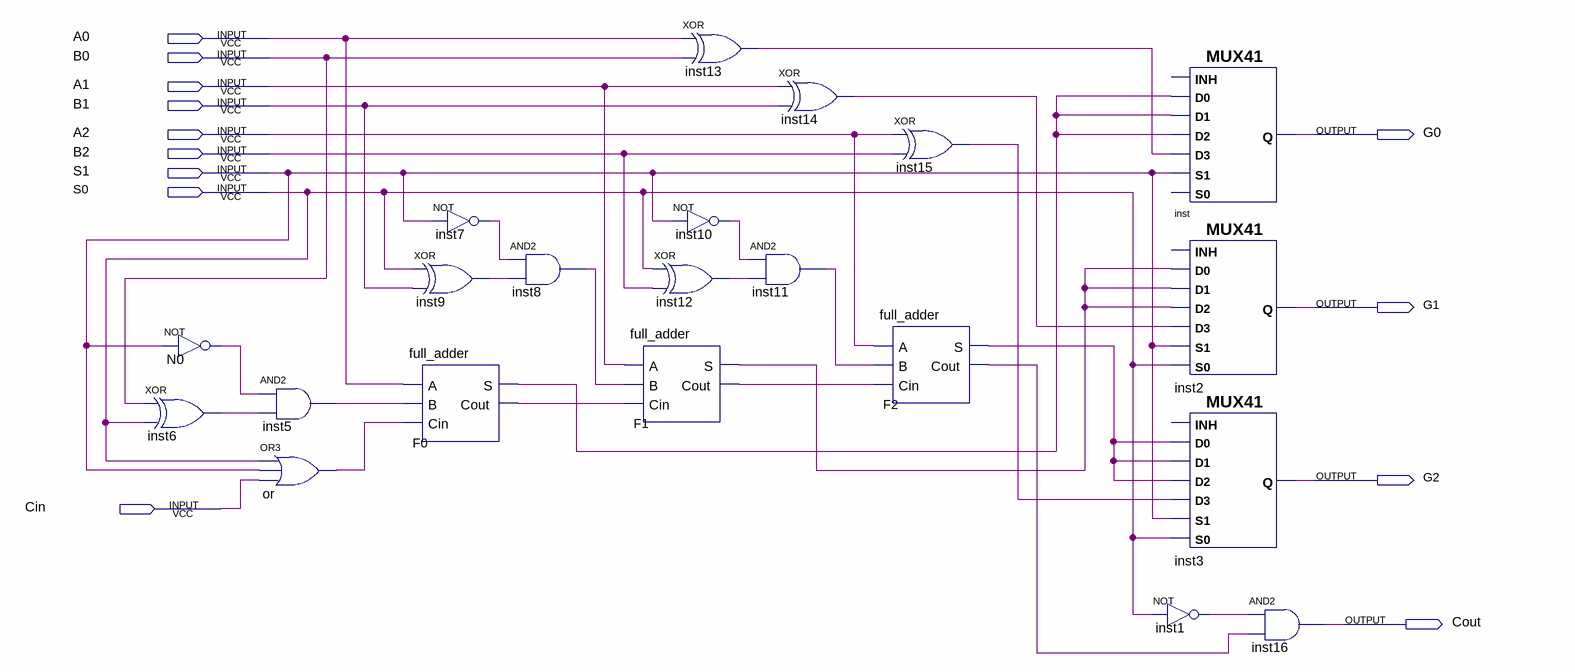
[diagram p0: schematic sheet]
// Quartus schematic CHF_Assign2.bdf as structural Verilog: 21 symbols, 13 pins
module CHF_Assign2 (
  input  A0,
  input  B0,
  input  A1,
  input  B1,
  input  A2,
  input  B2,
  input  S1,
  input  S0,
  input  Cin,
  output G0,
  output G1,
  output G2,
  output Cout
);

  wire F0_cout, F0_s, F1_cout, F1_s, F2_cout, F2_s, inst1_out, inst5_out, inst6_out, inst7_out, inst8_out,
       inst9_out, inst10_out, inst11_out, inst12_out, inst13_out, inst14_out, inst15_out, N0_out, or_out;

  not N0 (N0_out, S1);
  xor inst6 (inst6_out, B0, S0);
  and inst5 (inst5_out, N0_out, inst6_out);
  or \or  (or_out, S0, S1, Cin);
  xor inst9 (inst9_out, S0, B1);
  full_adder F0 (.A(A0), .B(inst5_out), .Cin(or_out), .S(F0_s), .Cout(F0_cout));
  not inst7 (inst7_out, S1);
  and inst8 (inst8_out, inst7_out, inst9_out);
  full_adder F1 (.A(A1), .B(inst8_out), .Cin(F0_cout), .S(F1_s), .Cout(F1_cout));
  xor inst13 (inst13_out, A0, B0);
  not inst10 (inst10_out, S1);
  xor inst12 (inst12_out, S0, B2);
  xor inst14 (inst14_out, A1, B1);
  and inst11 (inst11_out, inst10_out, inst12_out);
  full_adder F2 (.A(A2), .B(inst11_out), .Cin(F1_cout), .S(F2_s), .Cout(F2_cout));
  xor inst15 (inst15_out, A2, B2);
  MUX41 inst (.D2(F0_s), .S1(S1), .D3(inst13_out), .D0(F0_s), .D1(F0_s), .Q(G0));  // open: S0, INH
  MUX41 inst2 (.S0(S0), .D2(F1_s), .S1(S1), .D3(inst14_out), .D0(F1_s), .D1(F1_s), .Q(G1));  // open: INH
  MUX41 inst3 (.S0(S0), .D2(F2_s), .S1(S1), .D3(inst15_out), .D0(F2_s), .D1(F2_s), .Q(G2));  // open: INH
  not inst1 (inst1_out, S0);
  and inst16 (Cout, inst1_out, F2_cout);
endmodule
